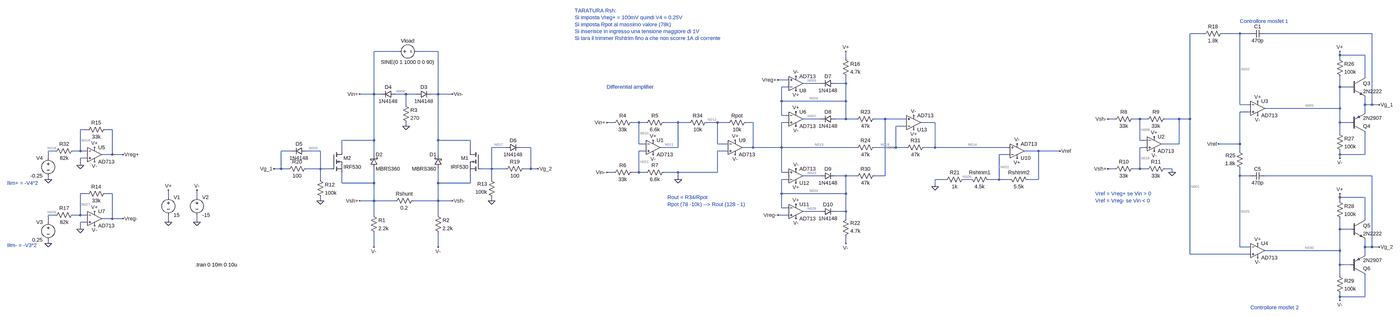
[diagram p0: schematic Electronic load.asc, whole sheet]
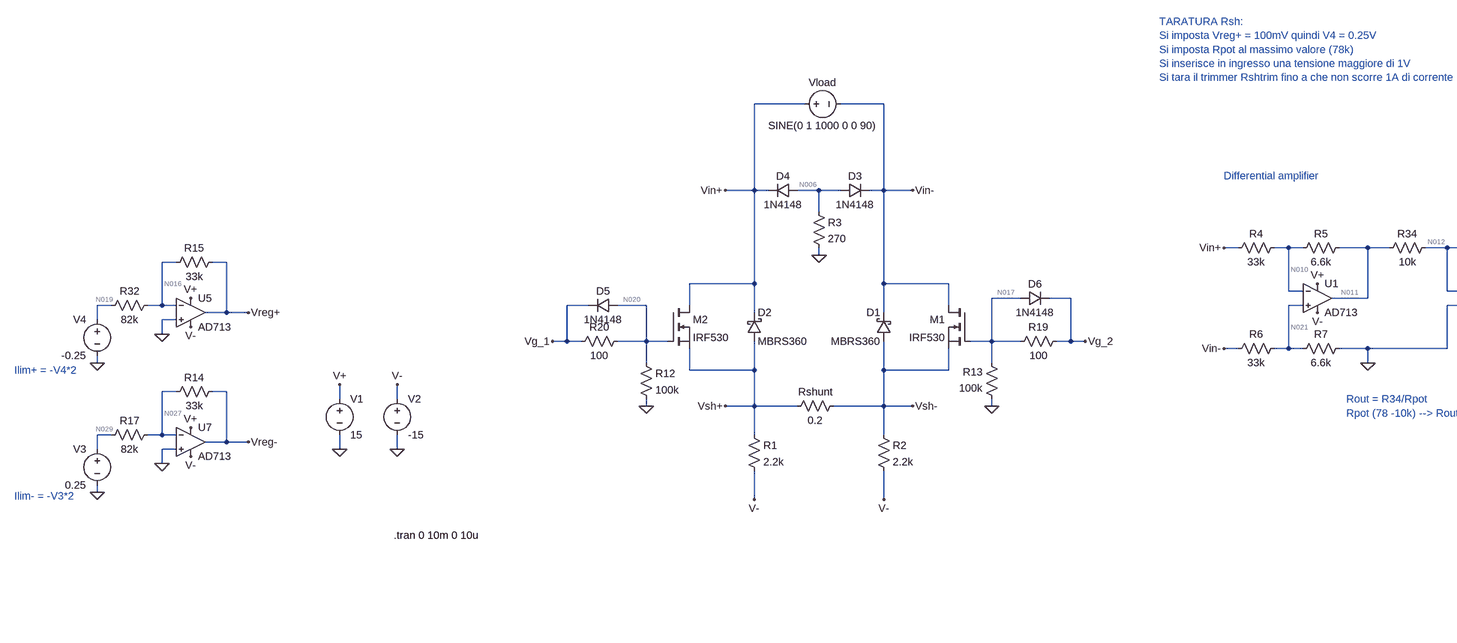
[diagram p1: schematic Electronic load.asc, part, row 1 of 1, column 1 of 2]
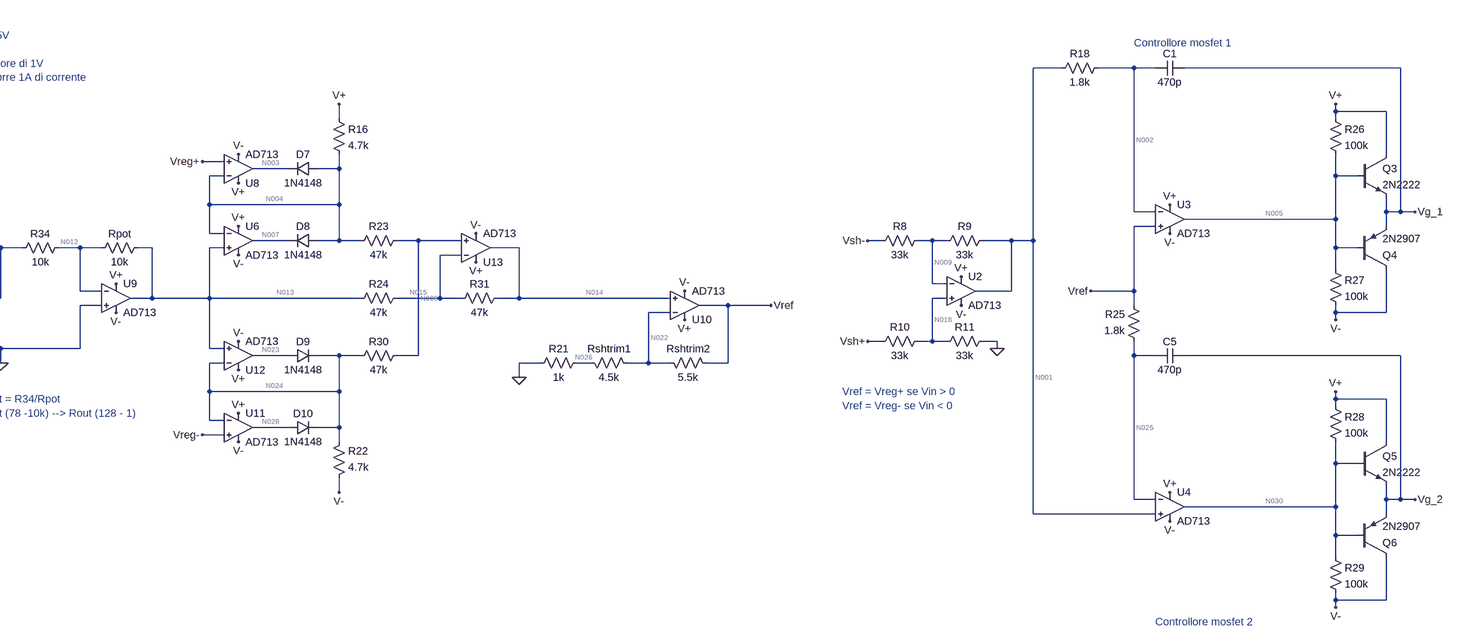
[diagram p2: schematic Electronic load.asc, part, row 1 of 1, column 2 of 2]
Electronic load.asc, the LTspice schematic file:
Version 4
SHEET 1 4684 1272
WIRE 3760 -576 3696 -576
WIRE 3920 -576 3840 -576
WIRE 3968 -576 3920 -576
WIRE 4576 -576 4032 -576
WIRE -144 -496 -256 -496
WIRE 32 -496 -64 -496
WIRE 4432 -480 4432 -496
WIRE 4544 -480 4432 -480
WIRE 2000 -464 2000 -496
WIRE 4432 -464 4432 -480
WIRE 4544 -384 4544 -480
WIRE 1744 -368 1696 -368
WIRE 1888 -352 1808 -352
WIRE 2000 -352 2000 -384
WIRE 2000 -352 1952 -352
WIRE 1744 -336 1712 -336
WIRE 4432 -336 4432 -384
WIRE 4480 -336 4432 -336
WIRE -256 -304 -256 -496
WIRE -256 -304 -320 -304
WIRE -224 -304 -256 -304
WIRE -112 -304 -160 -304
WIRE -64 -304 -112 -304
WIRE 32 -304 32 -496
WIRE 32 -304 0 -304
WIRE 96 -304 32 -304
WIRE 1712 -272 1712 -336
WIRE 2000 -272 2000 -352
WIRE 2000 -272 1712 -272
WIRE -112 -256 -112 -304
WIRE 3920 -256 3920 -576
WIRE 3968 -256 3920 -256
WIRE 4544 -256 4544 -288
WIRE 4576 -256 4576 -576
WIRE 4576 -256 4544 -256
WIRE 4608 -256 4576 -256
WIRE 4432 -240 4432 -336
WIRE 4432 -240 4032 -240
WIRE 3968 -224 3920 -224
WIRE 4544 -224 4544 -256
WIRE 1712 -208 1712 -272
WIRE 1744 -208 1712 -208
WIRE 1888 -192 1808 -192
WIRE 2000 -192 2000 -272
WIRE 2000 -192 1952 -192
WIRE 2048 -192 2000 -192
WIRE 2176 -192 2128 -192
WIRE 2272 -192 2176 -192
WIRE 3360 -192 3328 -192
WIRE 3472 -192 3440 -192
WIRE 3504 -192 3472 -192
WIRE 3648 -192 3584 -192
WIRE 3696 -192 3696 -576
WIRE 3696 -192 3648 -192
WIRE 960 -176 928 -176
WIRE 1072 -176 1040 -176
WIRE 1104 -176 1072 -176
WIRE 1248 -176 1184 -176
WIRE 1296 -176 1248 -176
WIRE 1424 -176 1376 -176
WIRE 1472 -176 1424 -176
WIRE 1584 -176 1552 -176
WIRE 1744 -176 1712 -176
WIRE 2400 -176 2336 -176
WIRE 4432 -176 4432 -240
WIRE 4480 -176 4432 -176
WIRE -112 -160 -112 -176
WIRE 2272 -160 2224 -160
WIRE -1664 -144 -1696 -144
WIRE -1552 -144 -1584 -144
WIRE 4432 -128 4432 -176
WIRE -256 -96 -256 -304
WIRE -256 -96 -400 -96
WIRE 32 -96 32 -304
WIRE 176 -96 32 -96
WIRE 3472 -96 3472 -192
WIRE 3504 -96 3472 -96
WIRE 1072 -80 1072 -176
WIRE 1104 -80 1072 -80
WIRE 1424 -80 1424 -176
WIRE 1472 -80 1424 -80
WIRE 3648 -80 3648 -192
WIRE 3648 -80 3568 -80
WIRE 3920 -80 3920 -224
WIRE 3920 -80 3824 -80
WIRE 336 -64 272 -64
WIRE 448 -64 400 -64
WIRE 1248 -64 1248 -176
WIRE 1248 -64 1168 -64
WIRE 1584 -64 1584 -176
WIRE 1584 -64 1536 -64
WIRE 1712 -64 1712 -176
WIRE 1712 -64 1584 -64
WIRE 2048 -64 1712 -64
WIRE 2224 -64 2224 -160
WIRE 2224 -64 2128 -64
WIRE 2272 -64 2224 -64
WIRE 2400 -64 2400 -176
WIRE 2400 -64 2352 -64
WIRE 2736 -64 2400 -64
WIRE 3504 -64 3472 -64
WIRE -1808 -48 -1840 -48
WIRE -1696 -48 -1696 -144
WIRE -1696 -48 -1728 -48
WIRE -1664 -48 -1696 -48
WIRE -624 -48 -672 -48
WIRE -496 -48 -560 -48
WIRE -400 -48 -400 -96
WIRE 176 -48 176 -96
WIRE 1104 -48 1072 -48
WIRE 1472 -48 1424 -48
WIRE 2864 -48 2800 -48
WIRE 2960 -48 2864 -48
WIRE 3920 -48 3920 -80
WIRE -1552 -32 -1552 -144
WIRE -1552 -32 -1600 -32
WIRE -1504 -32 -1552 -32
WIRE -256 -32 -256 -96
WIRE 32 -32 32 -96
WIRE 2736 -32 2688 -32
WIRE 4432 -32 4432 -48
WIRE 4544 -32 4544 -128
WIRE 4544 -32 4432 -32
WIRE -1840 -16 -1840 -48
WIRE -1664 -16 -1696 -16
WIRE 4432 -16 4432 -32
WIRE -1696 16 -1696 -16
WIRE -672 32 -672 -48
WIRE -672 32 -704 32
WIRE -640 32 -672 32
WIRE -496 32 -496 -48
WIRE -496 32 -560 32
WIRE -448 32 -496 32
WIRE 272 32 272 -64
WIRE 272 32 224 32
WIRE 336 32 272 32
WIRE 448 32 448 -64
WIRE 448 32 416 32
WIRE 480 32 448 32
WIRE 3360 32 3328 32
WIRE 3472 32 3472 -64
WIRE 3472 32 3440 32
WIRE 3504 32 3472 32
WIRE 3616 32 3584 32
WIRE 960 48 928 48
WIRE 1072 48 1072 -48
WIRE 1072 48 1040 48
WIRE 1104 48 1072 48
WIRE 1248 48 1184 48
WIRE 1424 48 1424 -48
WIRE 1424 48 1248 48
WIRE 1712 48 1712 -64
WIRE 1744 48 1712 48
WIRE 3616 48 3616 32
WIRE 1888 64 1808 64
WIRE 2000 64 1952 64
WIRE 2048 64 2000 64
WIRE 2176 64 2176 -192
WIRE 2176 64 2128 64
WIRE 3920 64 3920 32
WIRE 3968 64 3920 64
WIRE 4576 64 4032 64
WIRE -1840 80 -1840 64
WIRE -496 80 -496 32
WIRE 272 80 272 32
WIRE 1248 80 1248 48
WIRE 1744 80 1712 80
WIRE 2448 80 2400 80
WIRE 2560 80 2528 80
WIRE 2688 80 2688 -32
WIRE 2688 80 2640 80
WIRE 2736 80 2688 80
WIRE 2864 80 2864 -48
WIRE 2864 80 2816 80
WIRE -400 96 -400 48
WIRE -256 96 -256 32
WIRE -256 96 -400 96
WIRE 32 96 32 32
WIRE 176 96 176 48
WIRE 176 96 32 96
WIRE 2400 112 2400 80
WIRE -1664 144 -1696 144
WIRE -1552 144 -1584 144
WIRE 1712 144 1712 80
WIRE 2000 144 2000 64
WIRE 2000 144 1712 144
WIRE -1216 160 -1216 128
WIRE -1088 160 -1088 128
WIRE 4432 160 4432 144
WIRE 4544 160 4432 160
WIRE -496 176 -496 160
WIRE -256 176 -256 96
WIRE -256 176 -320 176
WIRE -160 176 -256 176
WIRE 32 176 32 96
WIRE 32 176 -80 176
WIRE 96 176 32 176
WIRE 272 176 272 160
WIRE 4432 176 4432 160
WIRE 1712 208 1712 144
WIRE 1744 208 1712 208
WIRE 1888 224 1808 224
WIRE 2000 224 2000 144
WIRE 2000 224 1952 224
WIRE -1808 240 -1840 240
WIRE -1696 240 -1696 144
WIRE -1696 240 -1728 240
WIRE -1664 240 -1696 240
WIRE -256 240 -256 176
WIRE 32 240 32 176
WIRE 1744 240 1696 240
WIRE -1552 256 -1552 144
WIRE -1552 256 -1600 256
WIRE -1504 256 -1552 256
WIRE 2000 256 2000 224
WIRE 4544 256 4544 160
WIRE -1840 272 -1840 240
WIRE -1664 272 -1696 272
WIRE -1216 272 -1216 240
WIRE -1088 272 -1088 240
WIRE -1696 304 -1696 272
WIRE 4432 304 4432 256
WIRE 4480 304 4432 304
WIRE -1840 368 -1840 352
WIRE 2000 368 2000 336
WIRE -256 384 -256 320
WIRE 32 384 32 320
WIRE 3920 384 3920 64
WIRE 3968 384 3920 384
WIRE 4544 384 4544 352
WIRE 4576 384 4576 64
WIRE 4576 384 4544 384
WIRE 4608 384 4576 384
WIRE 4432 400 4432 304
WIRE 4432 400 4032 400
WIRE 3696 416 3696 -192
WIRE 3968 416 3696 416
WIRE 4544 416 4544 384
WIRE 4432 464 4432 400
WIRE 4480 464 4432 464
WIRE 4432 512 4432 464
WIRE 4432 608 4432 592
WIRE 4544 608 4544 512
WIRE 4544 608 4432 608
WIRE 4432 624 4432 608
FLAG -1088 272 0
FLAG -1216 272 0
FLAG -1216 128 V+
FLAG -1088 128 V-
FLAG -256 384 V-
FLAG 32 384 V-
FLAG -112 -160 0
FLAG 1136 -32 V-
FLAG 1136 -96 V+
FLAG 1248 80 0
FLAG 3536 -48 V-
FLAG 3536 -112 V+
FLAG 3616 48 0
FLAG -320 -304 Vin+
FLAG 96 -304 Vin-
FLAG -320 176 Vsh+
FLAG 96 176 Vsh-
FLAG 928 48 Vin-
FLAG 928 -176 Vin+
FLAG 3328 32 Vsh+
FLAG 3328 -192 Vsh-
FLAG 480 32 Vg_2
FLAG 4000 -208 V-
FLAG 4000 -272 V+
FLAG 4608 -256 Vg_1
FLAG -704 32 Vg_1
FLAG 2960 -48 Vref
FLAG 3824 -80 Vref
FLAG -496 176 0
FLAG 272 176 0
FLAG 4432 -496 V+
FLAG 4432 -16 V-
FLAG 4000 432 V-
FLAG 4000 368 V+
FLAG 4432 144 V+
FLAG 4432 624 V-
FLAG 4608 384 Vg_2
FLAG -1632 0 V-
FLAG -1632 -64 V+
FLAG -1504 -32 Vreg+
FLAG -1840 80 0
FLAG -1696 16 0
FLAG -1632 288 V-
FLAG -1632 224 V+
FLAG -1504 256 Vreg-
FLAG -1840 368 0
FLAG -1696 304 0
FLAG 1504 -32 V-
FLAG 1504 -96 V+
FLAG 2768 -80 V-
FLAG 2768 -16 V+
FLAG 2400 112 0
FLAG 1776 -160 V-
FLAG 1776 -224 V+
FLAG 1776 -384 V-
FLAG 1776 -320 V+
FLAG 2000 -496 V+
FLAG 1776 256 V-
FLAG 1776 192 V+
FLAG 1776 32 V-
FLAG 1776 96 V+
FLAG 2000 368 V-
FLAG 2304 -208 V-
FLAG 2304 -144 V+
FLAG 1696 -368 Vreg+
FLAG 1696 240 Vreg-
SYMBOL voltage -1216 144 R0
SYMATTR InstName V1
SYMATTR Value 15
SYMBOL voltage -1088 144 R0
SYMATTR InstName V2
SYMATTR Value -15
SYMBOL nmos 224 -48 M0
SYMATTR InstName M1
SYMATTR Value IRF530
SYMBOL nmos -448 -48 R0
SYMATTR InstName M2
SYMATTR Value IRF530
SYMBOL schottky -272 32 M180
WINDOW 0 24 64 Left 2
WINDOW 3 24 0 Left 2
SYMATTR InstName D2
SYMATTR Value MBRS360
SYMATTR Description Diode
SYMATTR Type diode
SYMBOL res -176 192 R270
WINDOW 0 32 56 VTop 2
WINDOW 3 0 56 VBottom 2
SYMATTR InstName Rshunt
SYMATTR Value 0.2
SYMBOL res -272 224 R0
SYMATTR InstName R1
SYMATTR Value 2.2k
SYMBOL res 16 224 R0
SYMATTR InstName R2
SYMATTR Value 2.2k
SYMBOL diode -64 -320 M90
WINDOW 0 0 32 VBottom 2
WINDOW 3 32 32 VTop 2
SYMATTR InstName D3
SYMATTR Value 1N4148
SYMBOL diode -160 -288 M270
WINDOW 0 32 32 VTop 2
WINDOW 3 0 32 VBottom 2
SYMATTR InstName D4
SYMATTR Value 1N4148
SYMBOL res -128 -272 R0
SYMATTR InstName R3
SYMATTR Value 270
SYMBOL schottky 48 32 R180
WINDOW 0 24 64 Left 2
WINDOW 3 24 0 Left 2
SYMATTR InstName D1
SYMATTR Value MBRS360
SYMATTR Description Diode
SYMATTR Type diode
SYMBOL OpAmps\\AD713 1136 -128 R0
SYMATTR InstName U1
SYMBOL res 1056 -192 R90
WINDOW 0 0 56 VBottom 2
WINDOW 3 32 56 VTop 2
SYMATTR InstName R4
SYMATTR Value 33k
SYMBOL res 1200 -192 R90
WINDOW 0 0 56 VBottom 2
WINDOW 3 32 56 VTop 2
SYMATTR InstName R5
SYMATTR Value 6.6k
SYMBOL res 1056 32 R90
WINDOW 0 0 56 VBottom 2
WINDOW 3 32 56 VTop 2
SYMATTR InstName R6
SYMATTR Value 33k
SYMBOL res 1200 32 R90
WINDOW 0 0 56 VBottom 2
WINDOW 3 32 56 VTop 2
SYMATTR InstName R7
SYMATTR Value 6.6k
SYMBOL OpAmps\\AD713 3536 -144 R0
SYMATTR InstName U2
SYMBOL res 3456 -208 R90
WINDOW 0 0 56 VBottom 2
WINDOW 3 32 56 VTop 2
SYMATTR InstName R8
SYMATTR Value 33k
SYMBOL res 3600 -208 R90
WINDOW 0 0 56 VBottom 2
WINDOW 3 32 56 VTop 2
SYMATTR InstName R9
SYMATTR Value 33k
SYMBOL res 3456 16 R90
WINDOW 0 0 56 VBottom 2
WINDOW 3 32 56 VTop 2
SYMATTR InstName R10
SYMATTR Value 33k
SYMBOL res 3600 16 R90
WINDOW 0 0 56 VBottom 2
WINDOW 3 32 56 VTop 2
SYMATTR InstName R11
SYMATTR Value 33k
SYMBOL voltage -160 -496 M90
WINDOW 0 -32 56 VBottom 2
WINDOW 3 32 56 VTop 2
WINDOW 123 0 0 Left 0
WINDOW 39 0 0 Left 0
SYMATTR InstName Vload
SYMATTR Value SINE(0 1 1000 0 0 90)
SYMBOL OpAmps\\AD713 4000 -304 R0
SYMATTR InstName U3
SYMBOL res 432 16 R90
WINDOW 0 0 56 VBottom 2
WINDOW 3 32 56 VTop 2
SYMATTR InstName R19
SYMATTR Value 100
SYMBOL res -656 48 R270
WINDOW 0 32 56 VTop 2
WINDOW 3 0 56 VBottom 2
SYMATTR InstName R20
SYMATTR Value 100
SYMBOL cap 4032 -592 R90
WINDOW 0 0 32 VBottom 2
WINDOW 3 32 32 VTop 2
SYMATTR InstName C1
SYMATTR Value 470p
SYMBOL res 3856 -592 R90
WINDOW 0 0 56 VBottom 2
WINDOW 3 32 56 VTop 2
SYMATTR InstName R18
SYMATTR Value 1.8k
SYMBOL res -512 64 R0
SYMATTR InstName R12
SYMATTR Value 100k
SYMBOL res 288 176 R180
WINDOW 0 36 76 Left 2
WINDOW 3 36 40 Left 2
SYMATTR InstName R13
SYMATTR Value 100k
SYMBOL diode -560 -32 M270
WINDOW 0 32 32 VTop 2
WINDOW 3 0 32 VBottom 2
SYMATTR InstName D5
SYMATTR Value 1N4148
SYMBOL diode 336 -80 M90
WINDOW 0 0 32 VBottom 2
WINDOW 3 32 32 VTop 2
SYMATTR InstName D6
SYMATTR Value 1N4148
SYMBOL npn 4480 -384 R0
SYMATTR InstName Q3
SYMATTR Value 2N2222
SYMBOL pnp 4480 -128 M180
SYMATTR InstName Q4
SYMATTR Value 2N2907
SYMBOL res 4416 -480 R0
SYMATTR InstName R26
SYMATTR Value 100k
SYMBOL res 4416 -144 R0
SYMATTR InstName R27
SYMATTR Value 100k
SYMBOL OpAmps\\AD713 4000 336 R0
SYMATTR InstName U4
SYMBOL cap 4032 48 R90
WINDOW 0 0 32 VBottom 2
WINDOW 3 32 32 VTop 2
SYMATTR InstName C5
SYMATTR Value 470p
SYMBOL res 3936 48 R180
WINDOW 0 36 76 Left 2
WINDOW 3 36 40 Left 2
SYMATTR InstName R25
SYMATTR Value 1.8k
SYMBOL npn 4480 256 R0
SYMATTR InstName Q5
SYMATTR Value 2N2222
SYMBOL pnp 4480 512 M180
SYMATTR InstName Q6
SYMATTR Value 2N2907
SYMBOL res 4416 160 R0
SYMATTR InstName R28
SYMATTR Value 100k
SYMBOL res 4416 496 R0
SYMATTR InstName R29
SYMATTR Value 100k
SYMBOL OpAmps\\AD713 -1632 -96 R0
SYMATTR InstName U5
SYMBOL res -1568 -160 R90
WINDOW 0 0 56 VBottom 2
WINDOW 3 32 56 VTop 2
SYMATTR InstName R15
SYMATTR Value 33k
SYMBOL voltage -1840 -32 M0
WINDOW 123 0 0 Left 0
WINDOW 39 0 0 Left 0
SYMATTR InstName V4
SYMATTR Value -0.25
SYMBOL res -1824 -32 R270
WINDOW 0 32 56 VTop 2
WINDOW 3 0 56 VBottom 2
SYMATTR InstName R32
SYMATTR Value 82k
SYMBOL res 1392 -192 R90
WINDOW 0 0 56 VBottom 2
WINDOW 3 32 56 VTop 2
SYMATTR InstName R34
SYMATTR Value 10k
SYMBOL res 1568 -192 R90
WINDOW 0 0 56 VBottom 2
WINDOW 3 32 56 VTop 2
SYMATTR InstName Rpot
SYMATTR Value 10k
SYMBOL OpAmps\\AD713 -1632 192 R0
SYMATTR InstName U7
SYMBOL res -1568 128 R90
WINDOW 0 0 56 VBottom 2
WINDOW 3 32 56 VTop 2
SYMATTR InstName R14
SYMATTR Value 33k
SYMBOL voltage -1840 256 M0
WINDOW 123 0 0 Left 0
WINDOW 39 0 0 Left 0
SYMATTR InstName V3
SYMATTR Value 0.25
SYMBOL res -1824 256 R270
WINDOW 0 32 56 VTop 2
WINDOW 3 0 56 VBottom 2
SYMATTR InstName R17
SYMATTR Value 82k
SYMBOL OpAmps\\AD713 1504 -128 R0
SYMATTR InstName U9
SYMBOL OpAmps\\AD713 2768 16 M180
SYMATTR InstName U10
SYMBOL res 2832 96 M270
WINDOW 0 32 56 VTop 2
WINDOW 3 0 56 VBottom 2
SYMATTR InstName Rshtrim2
SYMATTR Value 5.5k
SYMBOL res 2656 96 M270
WINDOW 0 32 56 VTop 2
WINDOW 3 0 56 VBottom 2
SYMATTR InstName Rshtrim1
SYMATTR Value 4.5k
SYMBOL res 2544 64 R90
WINDOW 0 0 56 VBottom 2
WINDOW 3 32 56 VTop 2
SYMATTR InstName R21
SYMATTR Value 1k
SYMBOL OpAmps\\AD713 1776 -256 R0
SYMATTR InstName U6
SYMBOL OpAmps\\AD713 1776 -288 M180
SYMATTR InstName U8
SYMBOL diode 1952 -336 M270
WINDOW 0 32 32 VTop 2
WINDOW 3 0 32 VBottom 2
SYMATTR InstName D7
SYMATTR Value 1N4148
SYMBOL diode 1952 -176 M270
WINDOW 0 32 32 VTop 2
WINDOW 3 0 32 VBottom 2
SYMATTR InstName D8
SYMATTR Value 1N4148
SYMBOL res 1984 -480 R0
SYMATTR InstName R16
SYMATTR Value 4.7k
SYMBOL OpAmps\\AD713 1776 160 R0
SYMATTR InstName U11
SYMBOL OpAmps\\AD713 1776 128 M180
SYMATTR InstName U12
SYMBOL diode 1888 80 R270
WINDOW 0 32 32 VTop 2
WINDOW 3 0 32 VBottom 2
SYMATTR InstName D9
SYMATTR Value 1N4148
SYMBOL diode 1888 240 R270
WINDOW 0 32 32 VTop 2
WINDOW 3 0 32 VBottom 2
SYMATTR InstName D10
SYMATTR Value 1N4148
SYMBOL res 1984 352 M180
WINDOW 0 36 76 Left 2
WINDOW 3 36 40 Left 2
SYMATTR InstName R22
SYMATTR Value 4.7k
SYMBOL OpAmps\\AD713 2304 -112 M180
SYMATTR InstName U13
SYMBOL res 2144 -208 R90
WINDOW 0 0 56 VBottom 2
WINDOW 3 32 56 VTop 2
SYMATTR InstName R23
SYMATTR Value 47k
SYMBOL res 2144 -80 R90
WINDOW 0 0 56 VBottom 2
WINDOW 3 32 56 VTop 2
SYMATTR InstName R24
SYMATTR Value 47k
SYMBOL res 2144 48 R90
WINDOW 0 0 56 VBottom 2
WINDOW 3 32 56 VTop 2
SYMATTR InstName R30
SYMATTR Value 47k
SYMBOL res 2368 -80 R90
WINDOW 0 0 56 VBottom 2
WINDOW 3 32 56 VTop 2
SYMATTR InstName R31
SYMATTR Value 47k
TEXT -1096 464 Left 2 !.tran 0 10m 0 10u
TEXT 3272 144 Left 2 ;Vref = Vreg+ se Vin > 0\nVref = Vreg- se Vin < 0
TEXT 928 -336 Left 2 ;Differential amplifier
TEXT 3920 -632 Left 2 ;Controllore mosfet 1
TEXT 3968 656 Left 2 ;Controllore mosfet 2
TEXT 1200 192 Left 2 ;Rpot (78 -10k) --> Rout (128 - 1)
TEXT 1200 160 Left 2 ;Rout = R34/Rpot
TEXT -2024 96 Left 2 ;Ilim+ = -V4*2
TEXT -2024 376 Left 2 ;Ilim- = -V3*2
TEXT 784 -680 Left 2 ;TARATURA Rsh:\nSi imposta Vreg+ = 100mV quindi V4 = 0.25V\nSi imposta Rpot al massimo valore (78k)\nSi inserisce in ingresso una tensione maggiore di 1V\nSi tara il trimmer Rshtrim fino a che non scorre 1A di corrente

The netlist it stands for:
* Electronic load.asc
V1 V+ 0 15
V2 V- 0 -15
M1 Vin- N017 Vsh- Vsh- IRF530
M2 Vin+ N020 Vsh+ Vsh+ IRF530
D2 Vsh+ Vin+ MBRS360
Rshunt Vsh+ Vsh- 0.2
R1 Vsh+ V- 2.2k
R2 Vsh- V- 2.2k
D3 N006 Vin- 1N4148
D4 N006 Vin+ 1N4148
R3 N006 0 270
D1 Vsh- Vin- MBRS360
XU1 N021 N010 V+ V- N011 AD712  ; AD713, pins In+ In- V+ V- OUT
R4 N010 Vin+ 33k
R5 N011 N010 6.6k
R6 N021 Vin- 33k
R7 0 N021 6.6k
XU2 N018 N009 V+ V- N001 AD712  ; AD713, pins In+ In- V+ V- OUT
R8 N009 Vsh- 33k
R9 N001 N009 33k
R10 N018 Vsh+ 33k
R11 0 N018 33k
Vload Vin+ Vin- SINE(0 1 1000 0 0 90)
XU3 Vref N002 V+ V- N005 AD712  ; AD713, pins In+ In- V+ V- OUT
R19 Vg_2 N017 100
R20 Vg_1 N020 100
C1 Vg_1 N002 470p
R18 N002 N001 1.8k
R12 N020 0 100k
R13 0 N017 100k
D5 N020 Vg_1 1N4148
D6 N017 Vg_2 1N4148
Q3 V+ N005 Vg_1 0 2N2222
Q4 V- N005 Vg_1 0 2N2907
R26 V+ N005 100k
R27 N005 V- 100k
XU4 N001 N025 V+ V- N030 AD712  ; AD713, pins In+ In- V+ V- OUT
C5 Vg_2 N025 470p
R25 N025 Vref 1.8k
Q5 V+ N030 Vg_2 0 2N2222
Q6 V- N030 Vg_2 0 2N2907
R28 V+ N030 100k
R29 N030 V- 100k
XU5 0 N016 V+ V- Vreg+ AD712  ; AD713, pins In+ In- V+ V- OUT
R15 Vreg+ N016 33k
V4 N019 0 -0.25
R32 N019 N016 82k
R34 N012 N011 10k
Rpot N013 N012 10k
XU7 0 N027 V+ V- Vreg- AD712  ; AD713, pins In+ In- V+ V- OUT
R14 Vreg- N027 33k
V3 N029 0 0.25
R17 N029 N027 82k
XU9 0 N012 V+ V- N013 AD712  ; AD713, pins In+ In- V+ V- OUT
XU10 N014 N022 V+ V- Vref AD712  ; AD713, pins In+ In- V+ V- OUT
Rshtrim2 Vref N022 5.5k
Rshtrim1 N022 N026 4.5k
R21 N026 0 1k
XU6 N013 N004 V+ V- N007 AD712  ; AD713, pins In+ In- V+ V- OUT
XU8 Vreg+ N004 V+ V- N003 AD712  ; AD713, pins In+ In- V+ V- OUT
D7 N004 N003 1N4148
D8 N004 N007 1N4148
R16 V+ N004 4.7k
XU11 Vreg- N024 V+ V- N028 AD712  ; AD713, pins In+ In- V+ V- OUT
XU12 N013 N024 V+ V- N023 AD712  ; AD713, pins In+ In- V+ V- OUT
D9 N023 N024 1N4148
D10 N028 N024 1N4148
R22 V- N024 4.7k
XU13 N008 N015 V+ V- N014 AD712  ; AD713, pins In+ In- V+ V- OUT
R23 N008 N004 47k
R24 N015 N013 47k
R30 N008 N024 47k
R31 N014 N015 47k
.model D D
.lib standard.dio
.model NPN NPN
.model PNP PNP
.lib standard.bjt
.model NMOS NMOS
.model PMOS PMOS
.lib standard.mos
.tran 0 10m 0 10u
* Vref = Vreg+ se Vin > 0
* Vref = Vreg- se Vin < 0
* Differential amplifier
* Controllore mosfet 1
* Controllore mosfet 2
* Rpot (78 -10k) --> Rout (128 - 1)
* Rout = R34/Rpot
* Ilim+ = -V4*2
* Ilim- = -V3*2
* TARATURA Rsh:
* Si imposta Vreg+ = 100mV quindi V4 = 0.25V
* Si imposta Rpot al massimo valore (78k)
* Si inserisce in ingresso una tensione maggiore di 1V
* Si tara il trimmer Rshtrim fino a che non scorre 1A di corrente
.lib ADI1.lib
.backanno
.end

* Results of the author's LTspice run, read from the files saved beside the schematic
* Operating Point, zero values left out:
*   V(v+) = 15 V
*   V(v-) = -15 V
*   V(vin-) = -3.55 V
*   V(n017) = -1.665 V
*   V(vsh-) = -3.206 V
*   V(vin+) = -2.55 V
*   V(n020) = 1.718 V
*   V(vsh+) = -3.004 V
*   V(n006) = -2.853 V
*   V(n010) = -591.7 mV
*   V(n021) = -591.7 mV
*   V(n011) = -200 mV
*   V(n009) = -1.502 V
*   V(n018) = -1.502 V
*   V(n001) = 201.2 mV
*   V(n002) = 201.2 mV
*   V(vref) = 201.2 mV
*   V(n005) = 2.267 V
*   V(vg_2) = -1.667 V
*   V(vg_1) = 1.72 V
*   V(n025) = 201.2 mV
*   V(n030) = -2.213 V
*   V(n016) = -174 nV
*   V(vreg+) = 100.6 mV
*   V(n019) = -250 mV
*   V(n012) = -357 nV
*   V(n013) = 200 mV
*   V(n027) = 174 nV
*   V(vreg-) = -100.6 mV
*   V(n029) = 250 mV
*   V(n022) = 100.6 mV
*   V(n014) = 100.6 mV
*   V(n026) = 18.29 mV
*   V(n004) = 100.6 mV
*   V(n007) = 13.93 V
*   V(n003) = -537.7 mV
*   V(n024) = 200 mV
*   V(n028) = -14.18 V
*   V(n023) = 839.2 mV
*   V(n015) = 150.3 mV
*   V(n008) = 150.3 mV
*   Ic(Q3) = 17.11 µA
*   Ib(Q3) = 75.87 nA
*   Ie(Q3) = -17.18 µA
*   Ic(Q5) = 17.22 pA
*   Ib(Q5) = -17.76 pA
*   Ic(Q4) = -17.27 pA
*   Ib(Q4) = 17.82 pA
*   Ic(Q6) = -16.59 µA
*   Ib(Q6) = -59.97 nA
*   Ie(Q6) = 16.65 µA
*   Id(M1) = -31.96 µA
*   Is(M1) = 31.96 µA
*   Id(M2) = 1.011 A
*   Is(M2) = -1.011 A
*   I(D2) = -22.6 µA
*   I(D1) = 1.001 A
*   I(D3) = 10.57 mA
*   I(D4) = -2.517 nA
*   I(D5) = -93.77 pA
*   I(D6) = 94.33 pA
*   I(D7) = 3.171 mA
*   I(D8) = -2.534 nA
*   I(D9) = 3.235 mA
*   I(D10) = -2.534 nA
*   I(Rshunt) = 1.006 A
*   I(R1) = 5.453 mA
*   I(R2) = 5.361 mA
*   I(R3) = -10.57 mA
*   I(R4) = 59.35 µA
*   I(R5) = 59.35 µA
*   I(R6) = 89.65 µA
*   I(R7) = 89.65 µA
*   I(R8) = 51.62 µA
*   I(R9) = 51.62 µA
*   I(R10) = 45.52 µA
*   I(R11) = 45.52 µA
*   I(R19) = -16.65 µA
*   I(R20) = 17.18 µA
*   I(R18) = -25.54 pA
*   I(R12) = 17.18 µA
*   I(R13) = 16.65 µA
*   I(R26) = 127.3 µA
*   I(R27) = 172.7 µA
*   I(R25) = -25.54 pA
*   I(R28) = 172.1 µA
*   I(R29) = 127.9 µA
*   I(R15) = 3.049 µA
*   I(R32) = -3.049 µA
*   I(R34) = 20 µA
*   I(Rpot) = 20 µA
*   I(R14) = -3.049 µA
*   I(R17) = 3.049 µA
*   I(Rshtrim2) = 18.29 µA
*   I(Rshtrim1) = 18.29 µA
*   I(R21) = 18.29 µA
*   I(R16) = 3.17 mA
*   I(R22) = -3.234 mA
*   I(R23) = 1.057 µA
*   I(R24) = -1.057 µA
*   I(R30) = -1.057 µA
*   I(R31) = -1.057 µA
*   I(V1) = -70.01 mA
*   I(V2) = 80.67 mA
*   I(Vload) = -1.011 A
*   I(V4) = 3.049 µA
*   I(V3) = -3.049 µA
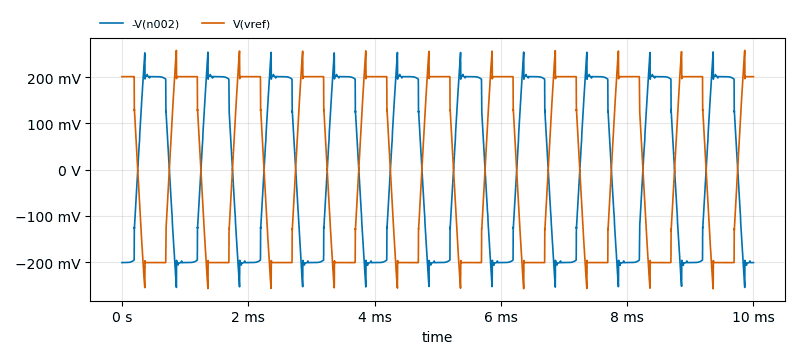
[diagram p3: Transient Analysis of Electronic load.asc, plotted from the saved traces]
* Transient Analysis, 1 run:
*   -V(n002): min -255 mV, max 254.8 mV, average 361 nV, rms 180.5 mV, last -201.2 mV
*   V(vref): min -258 mV, max 258.1 mV, average -626.7 nV, rms 181.9 mV, last 201.2 mV